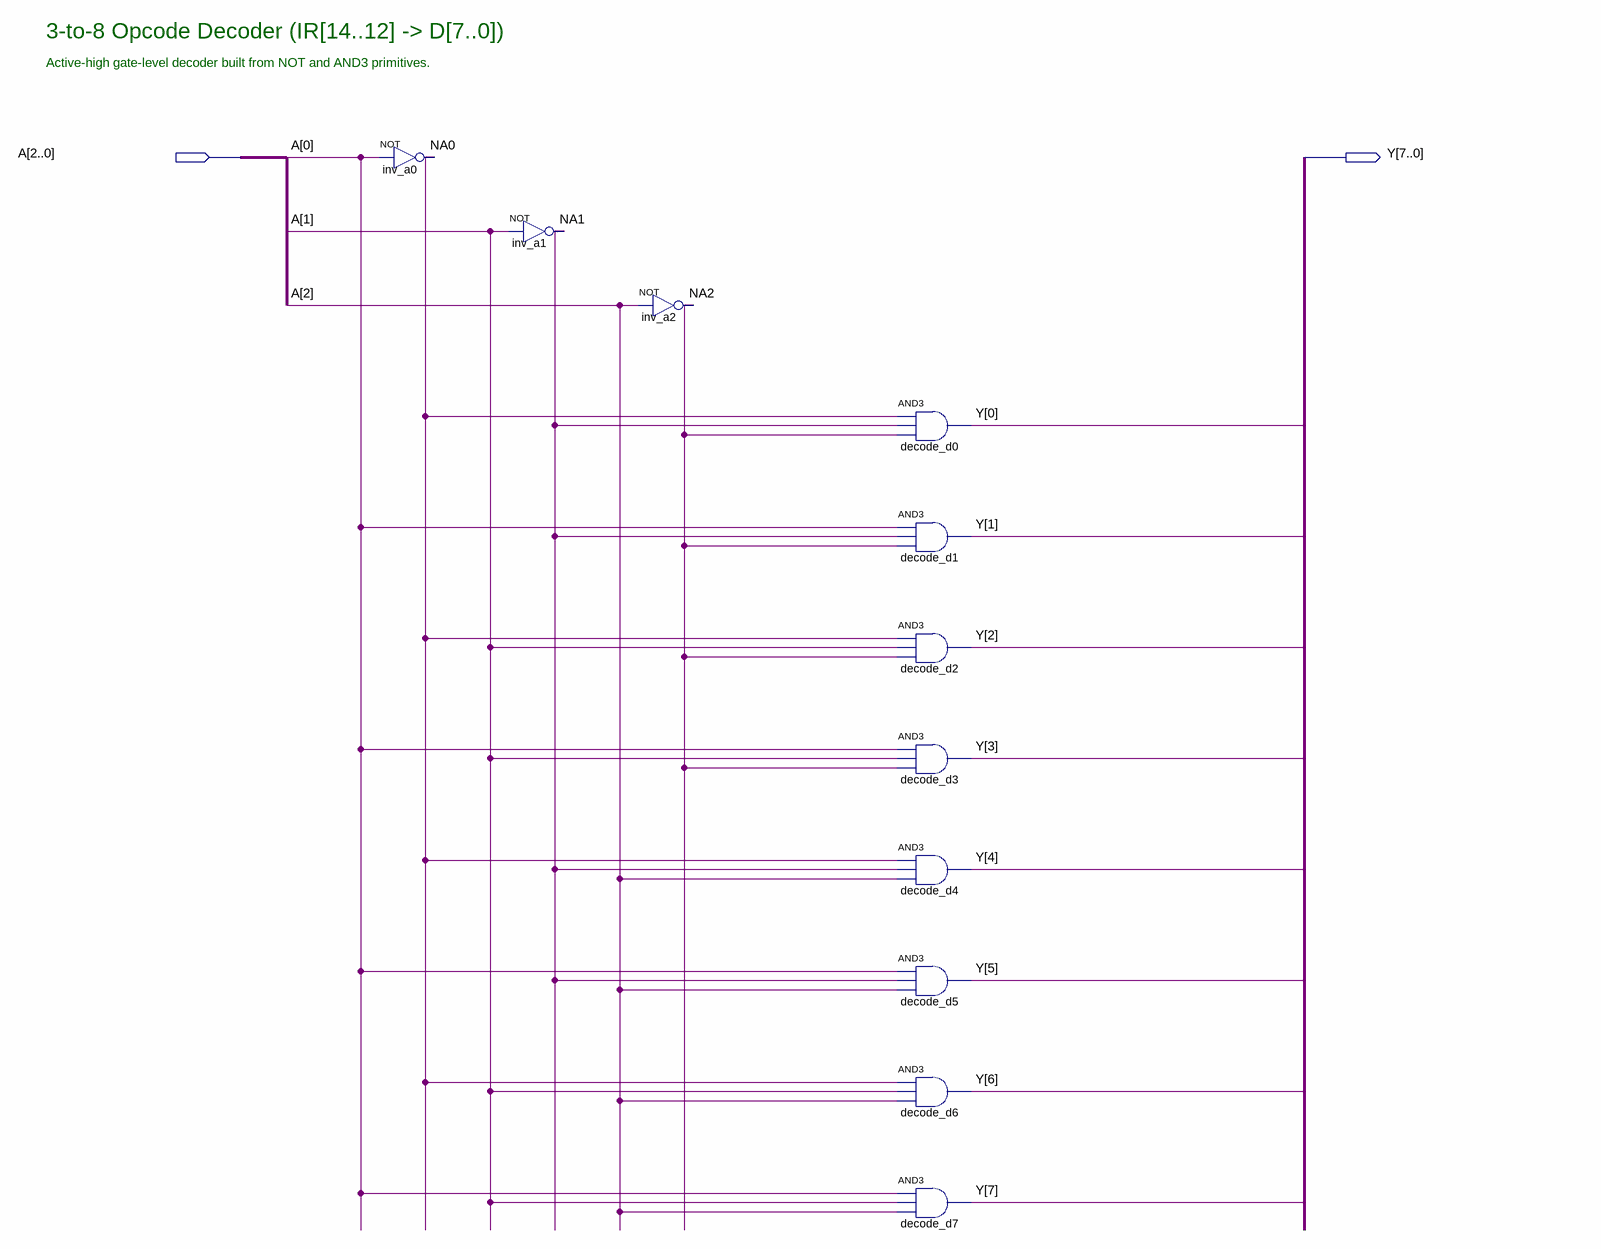
[diagram p0: schematic sheet]
// Quartus schematic dec38_en.bdf as structural Verilog: 11 symbols, 2 pins
module dec38_en (
  input  [2:0] A,
  output [7:0] Y
);

  wire NA0, NA1, NA2;

  not inv_a0 (NA0, A[0]);
  not inv_a1 (NA1, A[1]);
  not inv_a2 (NA2, A[2]);
  and decode_d0 (Y[0], NA0, NA1, NA2);
  and decode_d1 (Y[1], A[0], NA1, NA2);
  and decode_d2 (Y[2], NA0, A[1], NA2);
  and decode_d3 (Y[3], A[0], A[1], NA2);
  and decode_d4 (Y[4], NA0, NA1, A[2]);
  and decode_d5 (Y[5], A[0], NA1, A[2]);
  and decode_d6 (Y[6], NA0, A[1], A[2]);
  and decode_d7 (Y[7], A[0], A[1], A[2]);

  // Notes on the sheet:
  //   3-to-8 Opcode Decoder (IR[14..12] -> D[7..0])
  //   Active-high gate-level decoder built from NOT and AND3 primitives.
endmodule
